# Altium project STEPPER-Board-v1.0.PrjPcb (part 6 of 6)
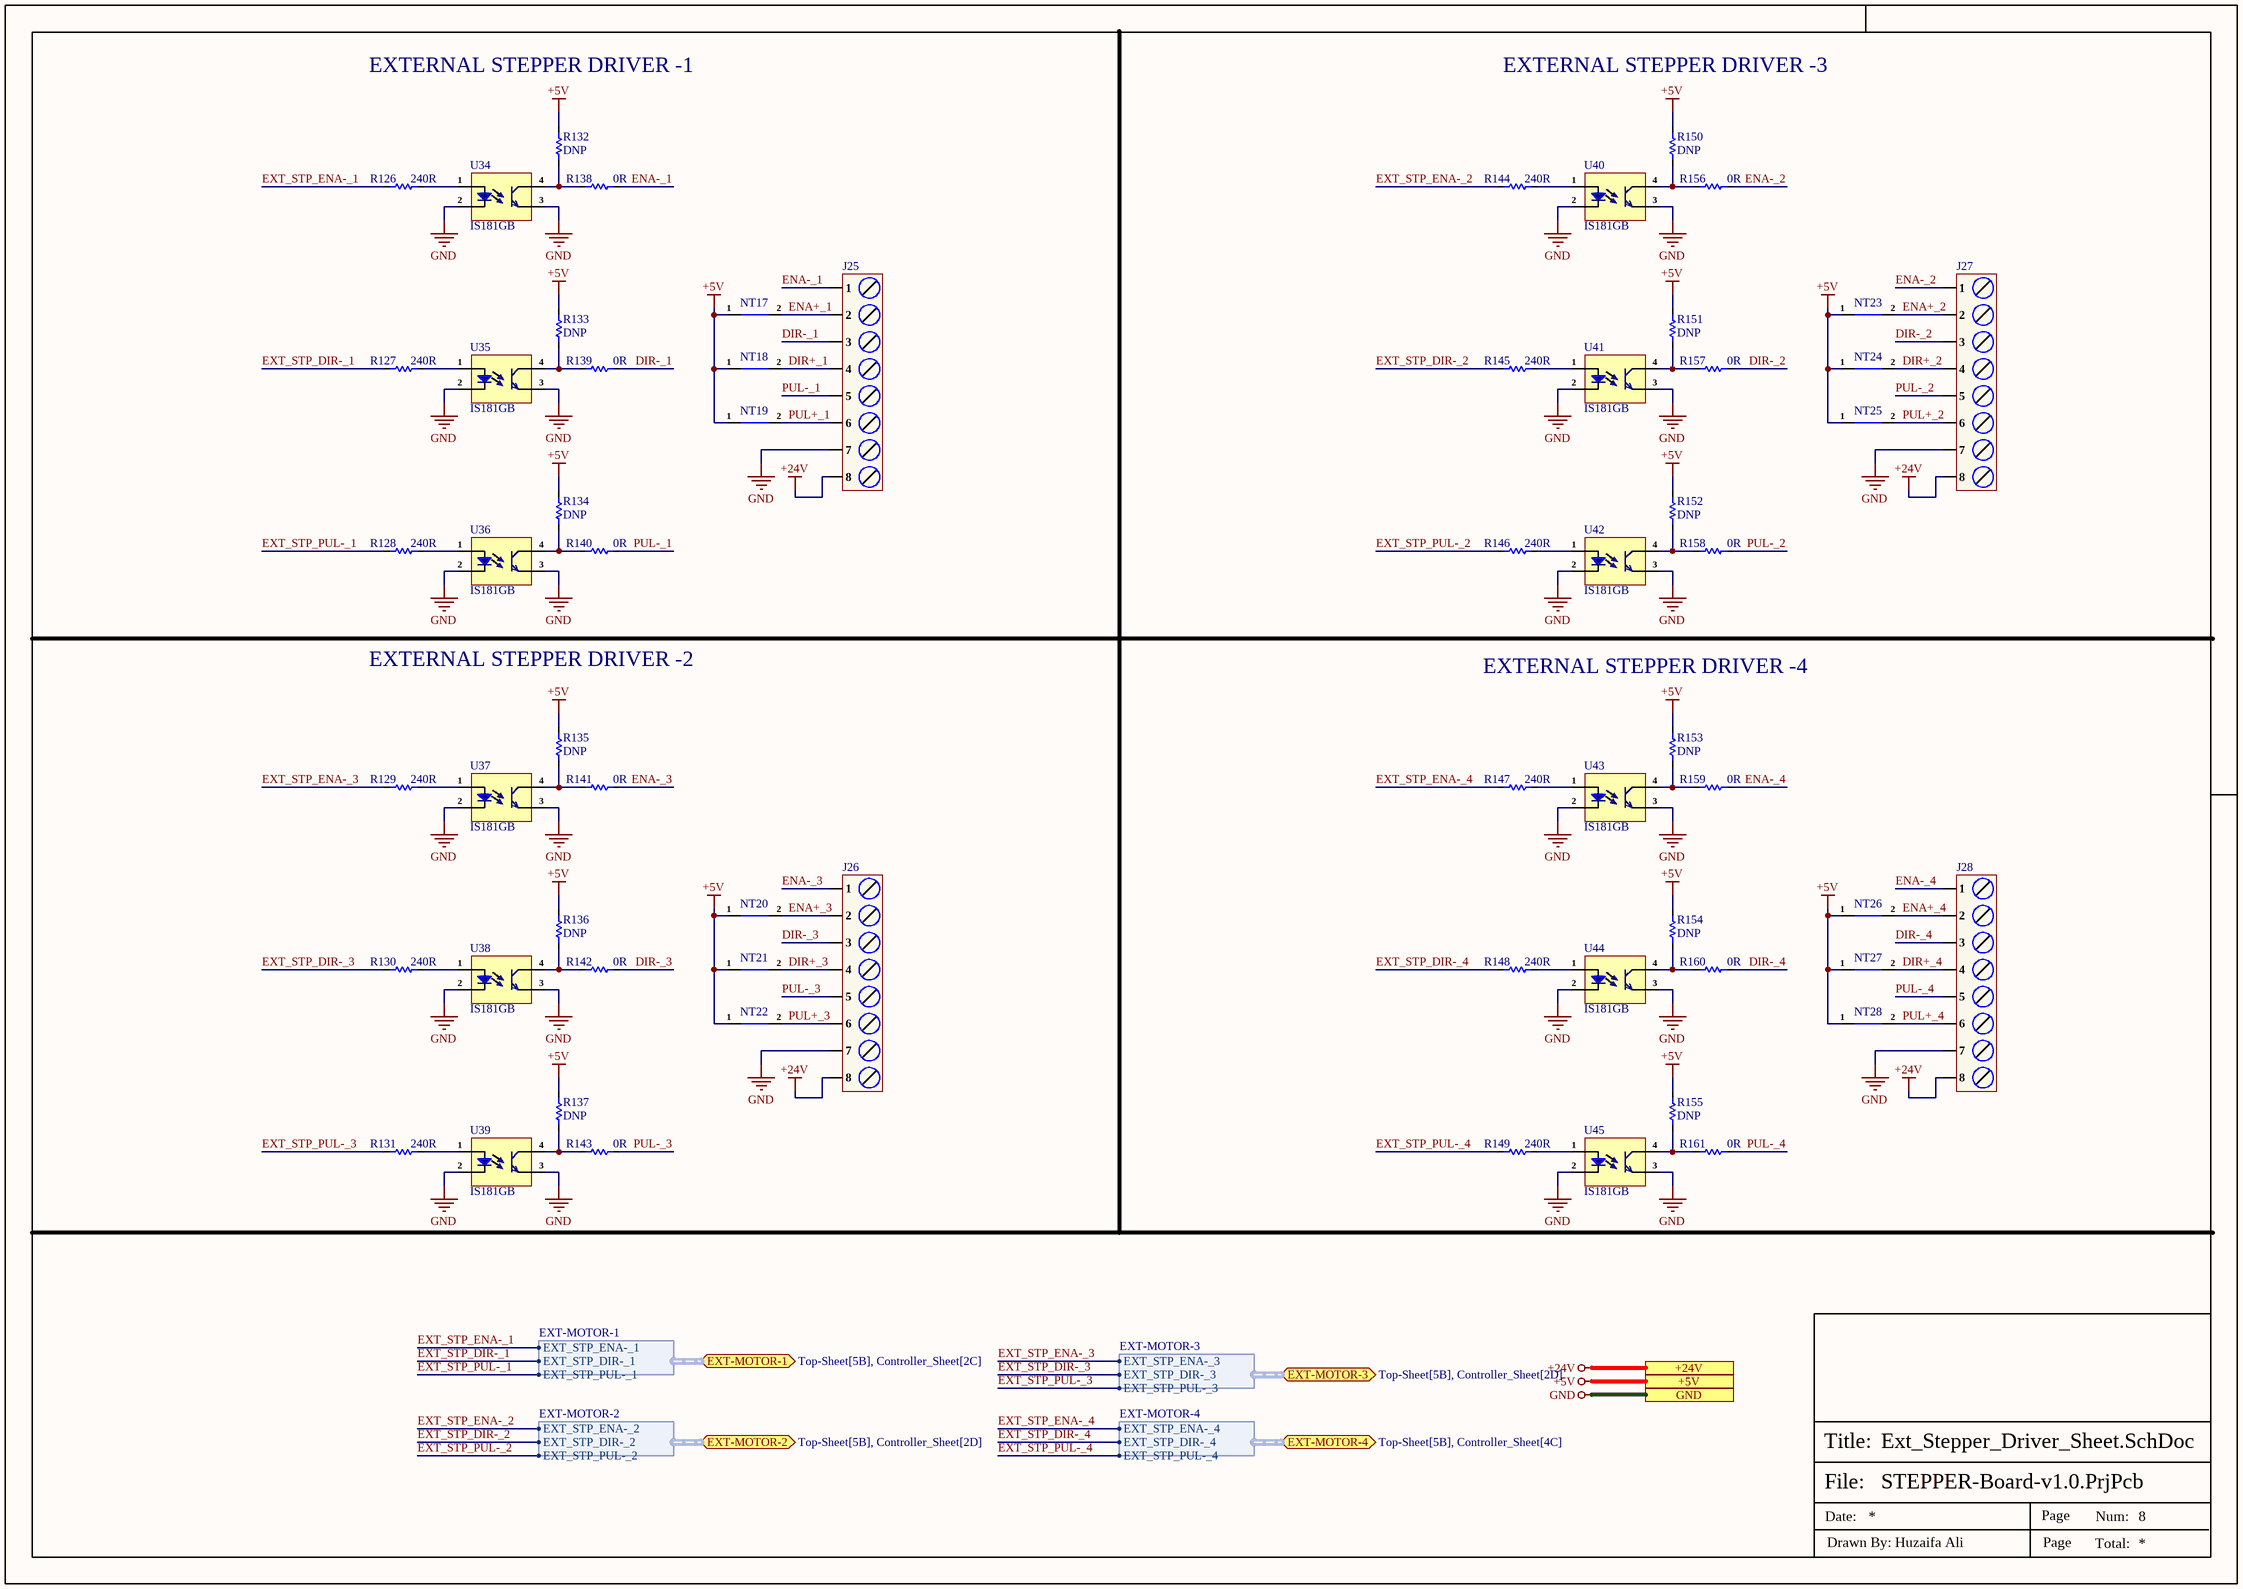
[diagram p9: Ext_Stepper_Driver_Sheet.SchDoc]

## Nets that join several sheets
+3V3: Power_Sheet (C22.2 R39.1 TP3.1 U6.3), Controller_Sheet (23 pins), CAN_Sheet (C24.2 C26.2 U7.5 U8.5), RS485_RS232_Sheet (9 pins), EtherCAT_Sheet (27 pins), Stepper_Driver_Sheet (13 pins)
+5V: Power_Sheet (9 pins), Controller_Sheet (R22.2), CAN_Sheet (10 pins), Ext_Stepper_Driver_Sheet (24 pins)
+24V: Power_Sheet (13 pins), Stepper_Driver_Sheet (48 pins), Ext_Stepper_Driver_Sheet (J25.8 J26.8 J27.8 J28.8)
GND: Power_Sheet (20 pins), Controller_Sheet (48 pins), CAN_Sheet (20 pins), RS485_RS232_Sheet (13 pins), EtherCAT_Sheet (46 pins), Stepper_Driver_Sheet (63 pins), Ext_Stepper_Driver_Sheet (28 pins)
BEMF-ADC-RDY: Controller_Sheet (U2.27), Stepper_Driver_Sheet (R107.2 U15.2)
CAN1_RX: Controller_Sheet (U2.50), CAN_Sheet (R44.2)
CAN1_TX: Controller_Sheet (U2.51), CAN_Sheet (R45.2)
CAN2_RX: Controller_Sheet (U2.15), CAN_Sheet (R46.2)
CAN2_TX: Controller_Sheet (U2.16), CAN_Sheet (R47.2)
DIR-1: Controller_Sheet (U3.25), Stepper_Driver_Sheet (U13.11)
DIR-2: Controller_Sheet (U3.26), Stepper_Driver_Sheet (U24.11)
DIR-3: Controller_Sheet (U3.27), Stepper_Driver_Sheet (U14.11)
DIR-4: Controller_Sheet (U3.28), Stepper_Driver_Sheet (U25.11)
EN_CAN: Controller_Sheet (U2.54), CAN_Sheet (U7.6)
EN_CAN_2: Controller_Sheet (U2.48), CAN_Sheet (U8.6)
EXT_STP_DIR-_1: Controller_Sheet (U3.5), Ext_Stepper_Driver_Sheet (R127.1)
EXT_STP_DIR-_2: Controller_Sheet (U3.6), Ext_Stepper_Driver_Sheet (R145.1)
EXT_STP_DIR-_3: Controller_Sheet (U3.7), Ext_Stepper_Driver_Sheet (R130.1)
EXT_STP_DIR-_4: Controller_Sheet (U3.8), Ext_Stepper_Driver_Sheet (R148.1)
EXT_STP_ENA-_1: Controller_Sheet (U3.1), Ext_Stepper_Driver_Sheet (R126.1)
EXT_STP_ENA-_2: Controller_Sheet (U3.2), Ext_Stepper_Driver_Sheet (R144.1)
EXT_STP_ENA-_3: Controller_Sheet (U3.3), Ext_Stepper_Driver_Sheet (R129.1)
EXT_STP_ENA-_4: Controller_Sheet (U3.4), Ext_Stepper_Driver_Sheet (R147.1)
EXT_STP_PUL-_1: Controller_Sheet (U2.59), Ext_Stepper_Driver_Sheet (R128.1)
EXT_STP_PUL-_2: Controller_Sheet (U2.58), Ext_Stepper_Driver_Sheet (R146.1)
EXT_STP_PUL-_3: Controller_Sheet (U2.57), Ext_Stepper_Driver_Sheet (R131.1)
EXT_STP_PUL-_4: Controller_Sheet (U2.56), Ext_Stepper_Driver_Sheet (R149.1)
FLT-1: Controller_Sheet (U1.1), Stepper_Driver_Sheet (R99.2 U13.18)
FLT-2: Controller_Sheet (U1.2), Stepper_Driver_Sheet (R114.2 U24.18)
FLT-3: Controller_Sheet (U1.3), Stepper_Driver_Sheet (R101.2 U14.18)
FLT-4: Controller_Sheet (U1.4), Stepper_Driver_Sheet (R116.2 U25.18)
I2C3_SCL: Controller_Sheet (5 pins), Stepper_Driver_Sheet (U15.10)
I2C3_SDA: Controller_Sheet (5 pins), Stepper_Driver_Sheet (U15.9)
INH_MASK: Controller_Sheet (U2.55), CAN_Sheet (U7.11)
INH_MASK_2: Controller_Sheet (U2.42), CAN_Sheet (U8.11)
nFAULT_CAN: Controller_Sheet (U2.53), CAN_Sheet (U7.8)
nFAULT_CAN_2: Controller_Sheet (U2.49), CAN_Sheet (U8.8)
nSLEEP-1: Controller_Sheet (U1.25), Stepper_Driver_Sheet (U13.8)
nSLEEP-2: Controller_Sheet (U1.26), Stepper_Driver_Sheet (U24.8)
nSLEEP-3: Controller_Sheet (U1.27), Stepper_Driver_Sheet (U14.8)
nSLEEP-4: Controller_Sheet (U1.28), Stepper_Driver_Sheet (U25.8)
nSTB_CAN: Controller_Sheet (U2.52), CAN_Sheet (U7.14)
nSTB_CAN_2: Controller_Sheet (U3.24), CAN_Sheet (U8.14)
RE/DE/RS485/T: Controller_Sheet (U2.18), RS485_RS232_Sheet (R59.1 R60.1 U9.2 U9.3)
RESET-1: Controller_Sheet (U1.21), Stepper_Driver_Sheet (U13.9)
RESET-2: Controller_Sheet (U1.22), Stepper_Driver_Sheet (U24.9)
RESET-3: Controller_Sheet (U1.23), Stepper_Driver_Sheet (U14.9)
RESET-4: Controller_Sheet (U1.24), Stepper_Driver_Sheet (U25.9)
RXD/RS232: Controller_Sheet (U2.31), RS485_RS232_Sheet (R70.2)
RXD/RS485: Controller_Sheet (U2.19), RS485_RS232_Sheet (R57.1)
SPI2_MISO: Controller_Sheet (U2.29), Stepper_Driver_Sheet (8 pins)
SPI2_MOSI: Controller_Sheet (U2.21), Stepper_Driver_Sheet (U13.15 U14.15 U24.15 U25.15)
SPI2_NSS-1: Controller_Sheet (U2.32), Stepper_Driver_Sheet (U13.16)
SPI2_NSS-2: Controller_Sheet (U2.22), Stepper_Driver_Sheet (U24.16)
SPI2_NSS-3: Controller_Sheet (U2.23), Stepper_Driver_Sheet (U14.16)
SPI2_NSS-4: Controller_Sheet (U2.24), Stepper_Driver_Sheet (U25.16)
SPI2_SCK: Controller_Sheet (U2.17), Stepper_Driver_Sheet (U13.14 U14.14 U24.14 U25.14)
SPI3_CS: Controller_Sheet (U2.47), EtherCAT_Sheet (U11.50)
SPI3_MISO: Controller_Sheet (U2.1), EtherCAT_Sheet (U11.13)
SPI3_MOSI: Controller_Sheet (U2.2), EtherCAT_Sheet (U11.17)
SPI3_SCK: Controller_Sheet (U2.64), EtherCAT_Sheet (U11.19)
STEP-1: Controller_Sheet (U2.63), Stepper_Driver_Sheet (U13.10)
STEP-2: Controller_Sheet (U2.62), Stepper_Driver_Sheet (U24.10)
STEP-3: Controller_Sheet (U2.61), Stepper_Driver_Sheet (U14.10)
STEP-4: Controller_Sheet (U2.60), Stepper_Driver_Sheet (U25.10)
STL-1: Controller_Sheet (U1.5), Stepper_Driver_Sheet (R100.2 U13.19)
STL-2: Controller_Sheet (U1.6), Stepper_Driver_Sheet (R115.2 U24.19)
STL-3: Controller_Sheet (U1.7), Stepper_Driver_Sheet (R102.2 U14.19)
STL-4: Controller_Sheet (U1.8), Stepper_Driver_Sheet (R117.2 U25.19)
SYNC0: Controller_Sheet (U2.37), EtherCAT_Sheet (U11.34)
SYNC1: Controller_Sheet (U2.3), EtherCAT_Sheet (U11.18)
TXD/RS232: Controller_Sheet (U2.30), RS485_RS232_Sheet (R69.2)
TXD/RS485: Controller_Sheet (U2.20), RS485_RS232_Sheet (R56.1)